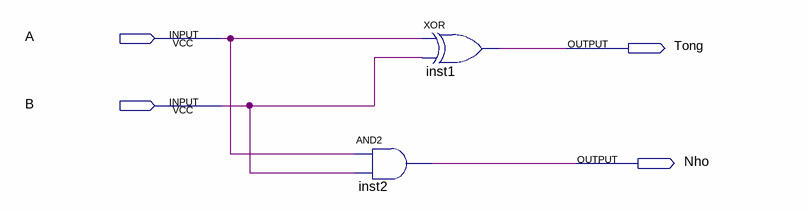
[diagram p0: schematic sheet]
// Quartus schematic HA.bdf as structural Verilog: 2 symbols, 4 pins
module HA (
  input  A,
  input  B,
  output Tong,
  output Nho
);

  and inst2 (Nho, A, B);
  xor inst1 (Tong, A, B);
endmodule
